# Altium schematic sheet 10-BBCON QCMI SOM.SchDoc: SOM Interface
size 431 x 279 mm; Designer: B. Jordan; DsnPath: G:\My Drive\Quilter Computer - Engineering Assets\NXP i.MX8M-Mini\8MMINILPD4-CPU2-DESIGNFILES\8MMINILPD4-CPU2-DESIGNFILES\SCH-47712_A4.DSN; Author: B. Jordan; DrawnBy: B. Jordan; Revision: 0; SheetNumber: 10; SheetTotal: 10; ENG_APP_DATE: --/--/--; DSN_APP_DATE: --/--/--; CHK_APP_DATE: --/--/--
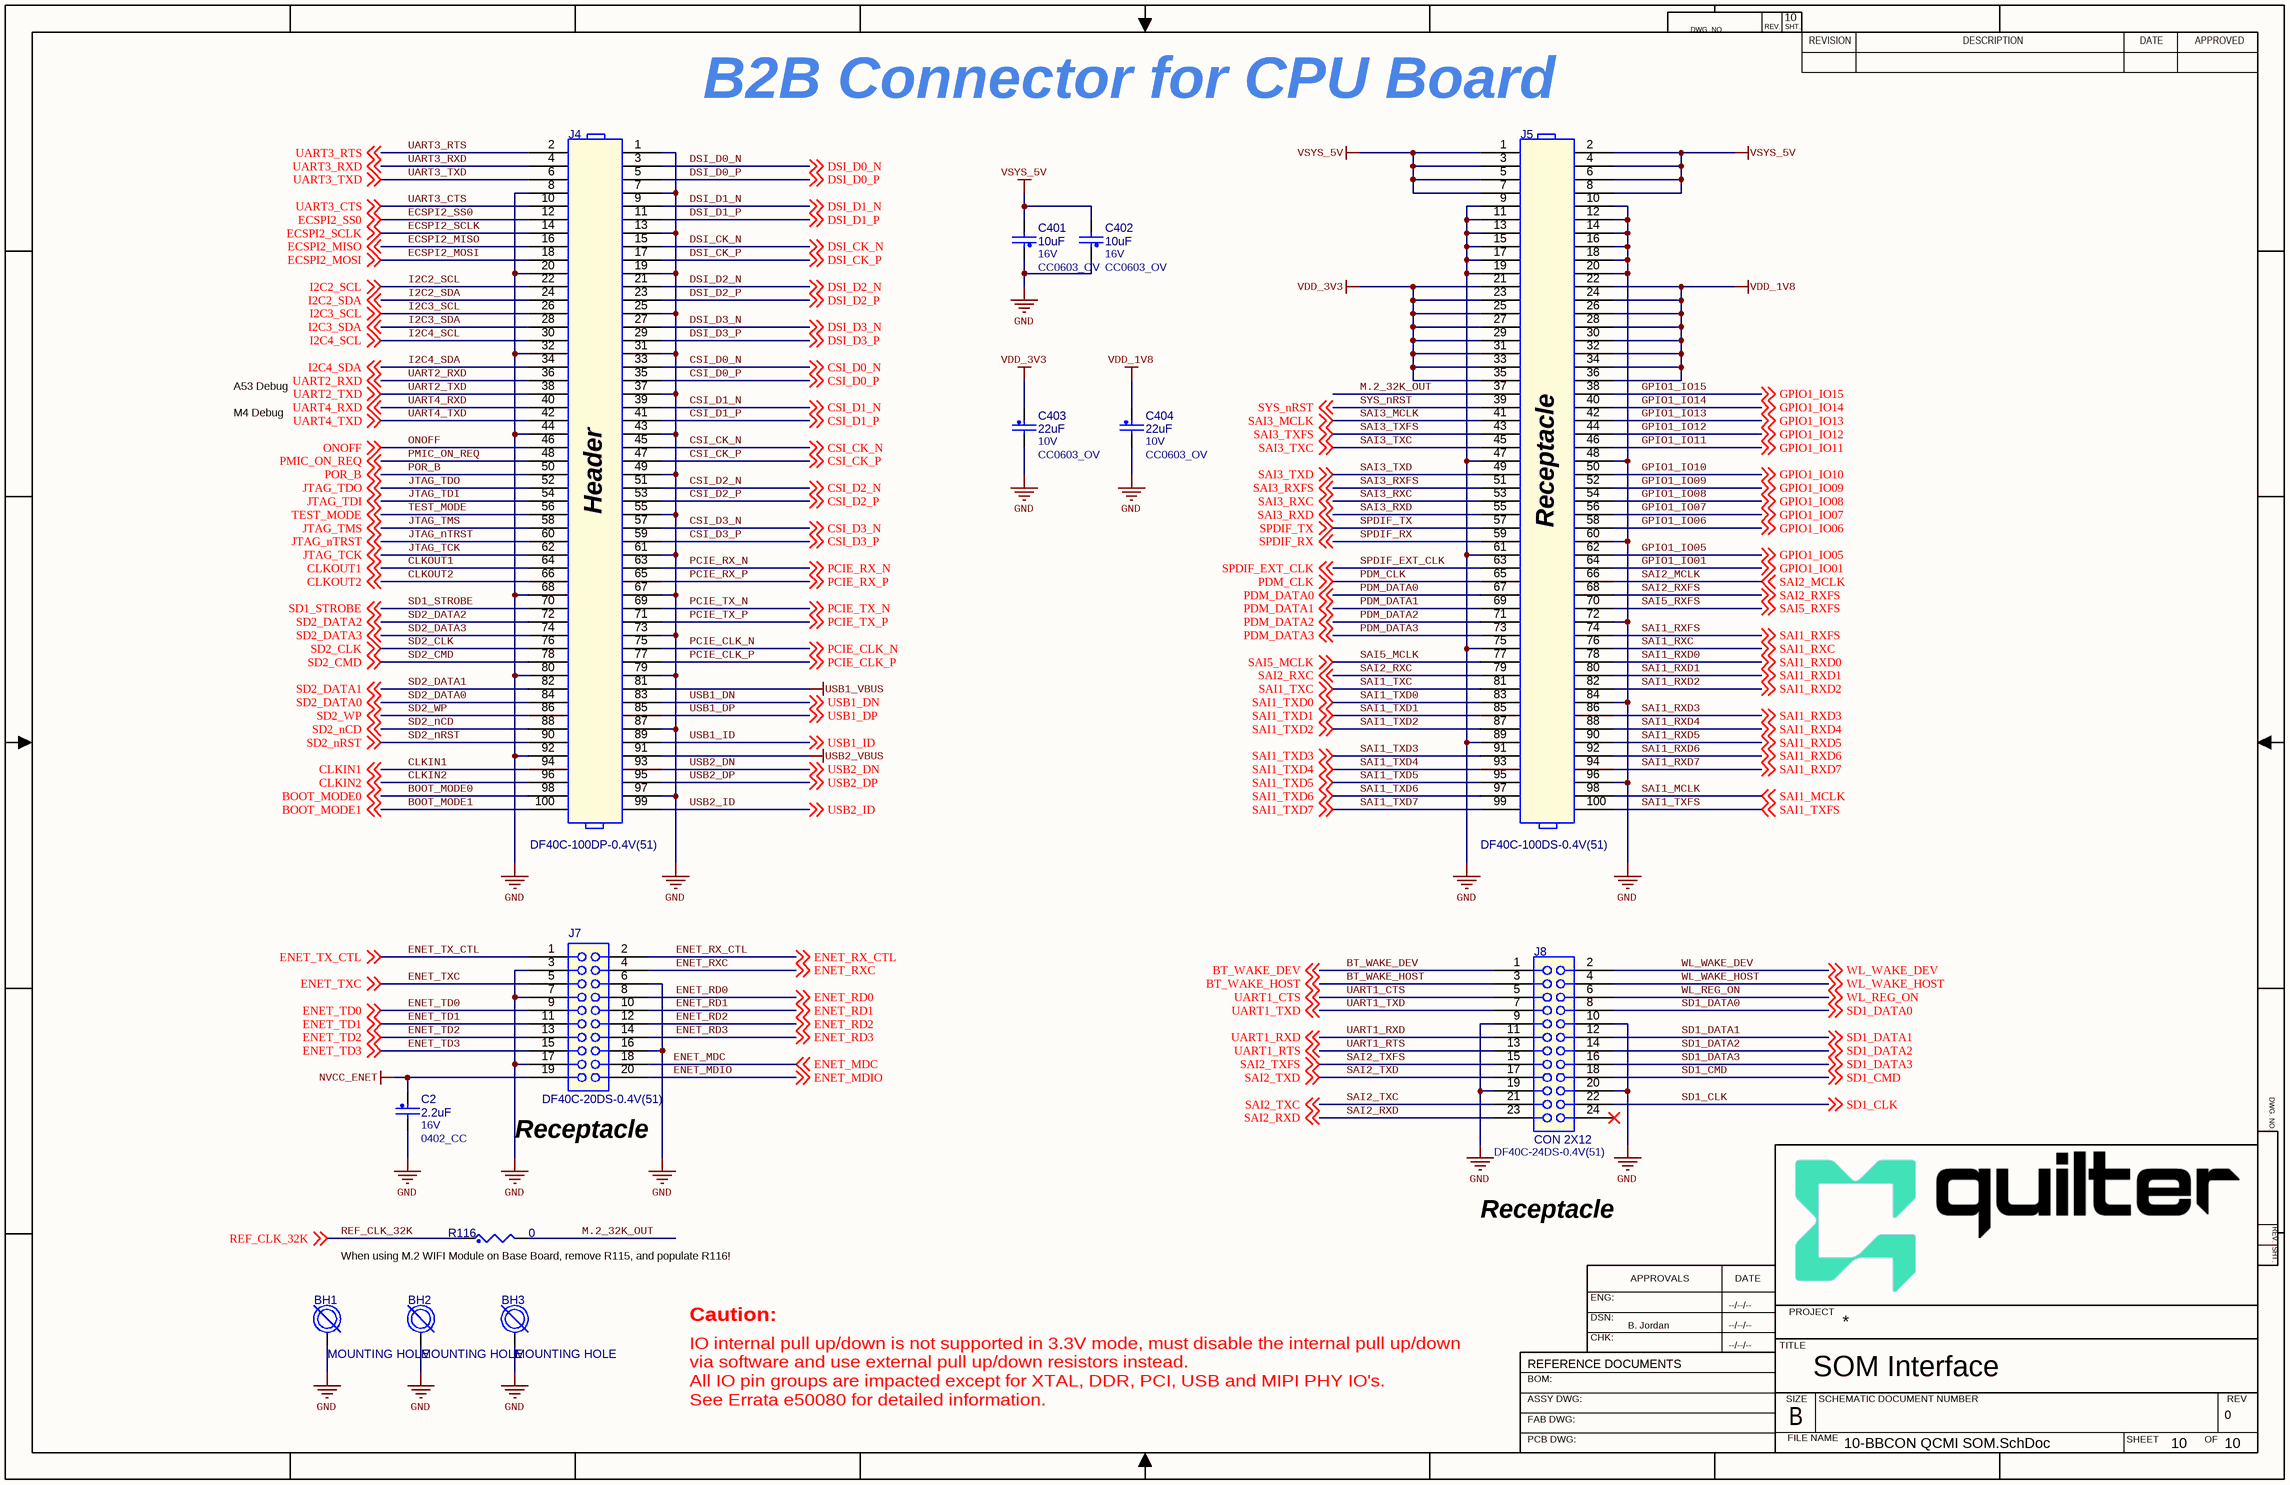
[diagram p0: 10-BBCON QCMI SOM.SchDoc]

## Parts
BH1  MOUNTING HOLE  [GNDPOINT256]
BH2  MOUNTING HOLE  [GNDPOINT256]
BH3  MOUNTING HOLE  [GNDPOINT256]
C2  2.2uF  VOLTAGE: 16V  [0402_CC]
C401  10uF  VOLTAGE: 16V  [CC0603_OV]
C402  10uF  VOLTAGE: 16V  [CC0603_OV]
C403  22uF  VOLTAGE: 10V  [CC0603_OV]
C404  22uF  VOLTAGE: 10V  [CC0603_OV]
J4  DF40C-100DP-0.4V(51)  [con100_0p4_21p7x2p05_sm]
J5  DF40C-100DS-0.4V(51)  [con100_0p4_22p8x3p1_sm]
J7  DF40C-20DS-0.4V(51)  [con20_0p4_6p8x3p1_sm]
J8  CON 2X12  MFG_PN01: DF40C-24DS-0.4V(51)  [con24_0p4_7p6x3p08_sm]
R116  0  [RC0402_25]

## Nets
GND: BH1.1 BH2.1 BH3.1 C2.2 C401.1 C402.1 C403.2 C404.2 J4.1 J4.7 J4.8 J4.13 J4.19 J4.20 J4.25 J4.31 J4.32 J4.37 J4.43 J4.44 J4.49 J4.55 J4.61 J4.67 J4.68 J4.73 J4.79 J4.80 J4.87 J4.92 J4.97 J5.9 J5.10 J5.11 J5.12 J5.13 J5.14 J5.15 J5.16 J5.17 J5.18 J5.19 J5.20 J5.47 J5.48 J5.60 J5.61 J5.72 J5.75 J5.84 J5.89 J5.96 J7.3 J7.6 J7.7 J7.16 J7.17 J8.9(A5) J8.10(B5) J8.19(A10) J8.20(B10)
NVCC_ENET: C2.1 J7.19
USB1_VBUS: J4.81
USB2_VBUS: J4.91
VDD_1V8: C404.1 J5.22 J5.24 J5.26 J5.28 J5.30 J5.32 J5.34 J5.36
VDD_3V3: C403.1 J5.21 J5.23 J5.25 J5.27 J5.29 J5.31 J5.33 J5.35
VSYS_5V: C401.2 C402.2 J5.1 J5.2 J5.3 J5.4 J5.5 J5.6 J5.7 J5.8
BOOT_MODE0: J4.98 ; off-sheet BOOT_MODE0
BOOT_MODE1: J4.100 ; off-sheet BOOT_MODE1
BT_WAKE_DEV: J8.1(A1) ; off-sheet BT_WAKE_DEV
BT_WAKE_HOST: J8.3(A2) ; off-sheet BT_WAKE_HOST
CLKIN1: J4.94 ; off-sheet CLKIN1
CLKIN2: J4.96 ; off-sheet CLKIN2
CLKOUT1: J4.64 ; off-sheet CLKOUT1
CLKOUT2: J4.66 ; off-sheet CLKOUT2
CSI_CK_N: J4.45 ; off-sheet CSI_CK_N
CSI_CK_P: J4.47 ; off-sheet CSI_CK_P
CSI_D0_N: J4.33 ; off-sheet CSI_D0_N
CSI_D0_P: J4.35 ; off-sheet CSI_D0_P
CSI_D1_N: J4.39 ; off-sheet CSI_D1_N
CSI_D1_P: J4.41 ; off-sheet CSI_D1_P
CSI_D2_N: J4.51 ; off-sheet CSI_D2_N
CSI_D2_P: J4.53 ; off-sheet CSI_D2_P
CSI_D3_N: J4.57 ; off-sheet CSI_D3_N
CSI_D3_P: J4.59 ; off-sheet CSI_D3_P
DSI_CK_N: J4.15 ; off-sheet DSI_CK_N
DSI_CK_P: J4.17 ; off-sheet DSI_CK_P
DSI_D0_N: J4.3 ; off-sheet DSI_D0_N
DSI_D0_P: J4.5 ; off-sheet DSI_D0_P
DSI_D1_N: J4.9 ; off-sheet DSI_D1_N
DSI_D1_P: J4.11 ; off-sheet DSI_D1_P
DSI_D2_N: J4.21 ; off-sheet DSI_D2_N
DSI_D2_P: J4.23 ; off-sheet DSI_D2_P
DSI_D3_N: J4.27 ; off-sheet DSI_D3_N
DSI_D3_P: J4.29 ; off-sheet DSI_D3_P
ECSPI2_MISO: J4.16 ; off-sheet ECSPI2_MISO
ECSPI2_MOSI: J4.18 ; off-sheet ECSPI2_MOSI
ECSPI2_SCLK: J4.14 ; off-sheet ECSPI2_SCLK
ECSPI2_SS0: J4.12 ; off-sheet ECSPI2_SS0
ENET_MDC: J7.18 ; off-sheet ENET_MDC
ENET_MDIO: J7.20 ; off-sheet ENET_MDIO
ENET_RD0: J7.8 ; off-sheet ENET_RD0
ENET_RD1: J7.10 ; off-sheet ENET_RD1
ENET_RD2: J7.12 ; off-sheet ENET_RD2
ENET_RD3: J7.14 ; off-sheet ENET_RD3
ENET_RX_CTL: J7.2 ; off-sheet ENET_RX_CTL
ENET_RXC: J7.4 ; off-sheet ENET_RXC
ENET_TD0: J7.9 ; off-sheet ENET_TD0
ENET_TD1: J7.11 ; off-sheet ENET_TD1
ENET_TD2: J7.13 ; off-sheet ENET_TD2
ENET_TD3: J7.15 ; off-sheet ENET_TD3
ENET_TX_CTL: J7.1 ; off-sheet ENET_TX_CTL
ENET_TXC: J7.5 ; off-sheet ENET_TXC
GPIO1_IO01: J5.64 ; off-sheet GPIO1_IO01
GPIO1_IO05: J5.62 ; off-sheet GPIO1_IO05
GPIO1_IO06: J5.58 ; off-sheet GPIO1_IO06
GPIO1_IO07: J5.56 ; off-sheet GPIO1_IO07
GPIO1_IO08: J5.54 ; off-sheet GPIO1_IO08
GPIO1_IO09: J5.52 ; off-sheet GPIO1_IO09
GPIO1_IO10: J5.50 ; off-sheet GPIO1_IO10
GPIO1_IO11: J5.46 ; off-sheet GPIO1_IO11
GPIO1_IO12: J5.44 ; off-sheet GPIO1_IO12
GPIO1_IO13: J5.42 ; off-sheet GPIO1_IO13
GPIO1_IO14: J5.40 ; off-sheet GPIO1_IO14
GPIO1_IO15: J5.38 ; off-sheet GPIO1_IO15
I2C2_SCL: J4.22 ; off-sheet I2C2_SCL
I2C2_SDA: J4.24 ; off-sheet I2C2_SDA
I2C3_SCL: J4.26 ; off-sheet I2C3_SCL
I2C3_SDA: J4.28 ; off-sheet I2C3_SDA
I2C4_SCL: J4.30 ; off-sheet I2C4_SCL
I2C4_SDA: J4.34 ; off-sheet I2C4_SDA
JTAG_nTRST: J4.60 ; off-sheet JTAG_nTRST
JTAG_TCK: J4.62 ; off-sheet JTAG_TCK
JTAG_TDI: J4.54 ; off-sheet JTAG_TDI
JTAG_TDO: J4.52 ; off-sheet JTAG_TDO
JTAG_TMS: J4.58 ; off-sheet JTAG_TMS
M.2_32K_OUT: J5.37 R116.2
ONOFF: J4.46 ; off-sheet ONOFF
PCIE_CLK_N: J4.75 ; off-sheet PCIE_CLK_N
PCIE_CLK_P: J4.77 ; off-sheet PCIE_CLK_P
PCIE_RX_N: J4.63 ; off-sheet PCIE_RX_N
PCIE_RX_P: J4.65 ; off-sheet PCIE_RX_P
PCIE_TX_N: J4.69 ; off-sheet PCIE_TX_N
PCIE_TX_P: J4.71 ; off-sheet PCIE_TX_P
PDM_CLK: J5.65 ; off-sheet PDM_CLK
PDM_DATA0: J5.67 ; off-sheet PDM_DATA0
PDM_DATA1: J5.69 ; off-sheet PDM_DATA1
PDM_DATA2: J5.71 ; off-sheet PDM_DATA2
PDM_DATA3: J5.73 ; off-sheet PDM_DATA3
PMIC_ON_REQ: J4.48 ; off-sheet PMIC_ON_REQ
POR_B: J4.50 ; off-sheet POR_B
REF_CLK_32K: R116.1 ; off-sheet REF_CLK_32K
SAI1_MCLK: J5.98 ; off-sheet SAI1_MCLK
SAI1_RXC: J5.76 ; off-sheet SAI1_RXC
SAI1_RXD0: J5.78 ; off-sheet SAI1_RXD0
SAI1_RXD1: J5.80 ; off-sheet SAI1_RXD1
SAI1_RXD2: J5.82 ; off-sheet SAI1_RXD2
SAI1_RXD3: J5.86 ; off-sheet SAI1_RXD3
SAI1_RXD4: J5.88 ; off-sheet SAI1_RXD4
SAI1_RXD5: J5.90 ; off-sheet SAI1_RXD5
SAI1_RXD6: J5.92 ; off-sheet SAI1_RXD6
SAI1_RXD7: J5.94 ; off-sheet SAI1_RXD7
SAI1_RXFS: J5.74 ; off-sheet SAI1_RXFS
SAI1_TXC: J5.81 ; off-sheet SAI1_TXC
SAI1_TXD0: J5.83 ; off-sheet SAI1_TXD0
SAI1_TXD1: J5.85 ; off-sheet SAI1_TXD1
SAI1_TXD2: J5.87 ; off-sheet SAI1_TXD2
SAI1_TXD3: J5.91 ; off-sheet SAI1_TXD3
SAI1_TXD4: J5.93 ; off-sheet SAI1_TXD4
SAI1_TXD5: J5.95 ; off-sheet SAI1_TXD5
SAI1_TXD6: J5.97 ; off-sheet SAI1_TXD6
SAI1_TXD7: J5.99 ; off-sheet SAI1_TXD7
SAI1_TXFS: J5.100 ; off-sheet SAI1_TXFS
SAI2_MCLK: J5.66 ; off-sheet SAI2_MCLK
SAI2_RXC: J5.79 ; off-sheet SAI2_RXC
SAI2_RXD: J8.23(A12) ; off-sheet SAI2_RXD
SAI2_RXFS: J5.68 ; off-sheet SAI2_RXFS
SAI2_TXC: J8.21(A11) ; off-sheet SAI2_TXC
SAI2_TXD: J8.17(A9) ; off-sheet SAI2_TXD
SAI2_TXFS: J8.15(A8) ; off-sheet SAI2_TXFS
SAI3_MCLK: J5.41 ; off-sheet SAI3_MCLK
SAI3_RXC: J5.53 ; off-sheet SAI3_RXC
SAI3_RXD: J5.55 ; off-sheet SAI3_RXD
SAI3_RXFS: J5.51 ; off-sheet SAI3_RXFS
SAI3_TXC: J5.45 ; off-sheet SAI3_TXC
SAI3_TXD: J5.49 ; off-sheet SAI3_TXD
SAI3_TXFS: J5.43 ; off-sheet SAI3_TXFS
SAI5_MCLK: J5.77 ; off-sheet SAI5_MCLK
SAI5_RXFS: J5.70 ; off-sheet SAI5_RXFS
SD1_CLK: J8.22(B11) ; off-sheet SD1_CLK
SD1_CMD: J8.18(B9) ; off-sheet SD1_CMD
SD1_DATA0: J8.8(B4) ; off-sheet SD1_DATA0
SD1_DATA1: J8.12(B6) ; off-sheet SD1_DATA1
SD1_DATA2: J8.14(B7) ; off-sheet SD1_DATA2
SD1_DATA3: J8.16(B8) ; off-sheet SD1_DATA3
SD1_STROBE: J4.70 ; off-sheet SD1_STROBE
SD2_CLK: J4.76 ; off-sheet SD2_CLK
SD2_CMD: J4.78 ; off-sheet SD2_CMD
SD2_DATA0: J4.84 ; off-sheet SD2_DATA0
SD2_DATA1: J4.82 ; off-sheet SD2_DATA1
SD2_DATA2: J4.72 ; off-sheet SD2_DATA2
SD2_DATA3: J4.74 ; off-sheet SD2_DATA3
SD2_nCD: J4.88 ; off-sheet SD2_nCD
SD2_nRST: J4.90 ; off-sheet SD2_nRST
SD2_WP: J4.86 ; off-sheet SD2_WP
SPDIF_EXT_CLK: J5.63 ; off-sheet SPDIF_EXT_CLK
SPDIF_RX: J5.59 ; off-sheet SPDIF_RX
SPDIF_TX: J5.57 ; off-sheet SPDIF_TX
SYS_nRST: J5.39 ; off-sheet SYS_nRST
TEST_MODE: J4.56 ; off-sheet TEST_MODE
UART1_CTS: J8.5(A3) ; off-sheet UART1_CTS
UART1_RTS: J8.13(A7) ; off-sheet UART1_RTS
UART1_RXD: J8.11(A6) ; off-sheet UART1_RXD
UART1_TXD: J8.7(A4) ; off-sheet UART1_TXD
UART2_RXD: J4.36 ; off-sheet UART2_RXD
UART2_TXD: J4.38 ; off-sheet UART2_TXD
UART3_CTS: J4.10 ; off-sheet UART3_CTS
UART3_RTS: J4.2 ; off-sheet UART3_RTS
UART3_RXD: J4.4 ; off-sheet UART3_RXD
UART3_TXD: J4.6 ; off-sheet UART3_TXD
UART4_RXD: J4.40 ; off-sheet UART4_RXD
UART4_TXD: J4.42 ; off-sheet UART4_TXD
USB1_DN: J4.83 ; off-sheet USB1_DN
USB1_DP: J4.85 ; off-sheet USB1_DP
USB1_ID: J4.89 ; off-sheet USB1_ID
USB2_DN: J4.93 ; off-sheet USB2_DN
USB2_DP: J4.95 ; off-sheet USB2_DP
USB2_ID: J4.99 ; off-sheet USB2_ID
WL_REG_ON: J8.6(B3) ; off-sheet WL_REG_ON
WL_WAKE_DEV: J8.2(B1) ; off-sheet WL_WAKE_DEV
WL_WAKE_HOST: J8.4(B2) ; off-sheet WL_WAKE_HOST

Not connected (* = marked no-connect by the designer): J8 24(B12)*

## Notes on the sheet
- (near J5) B2B Connector for CPU Board
- A53 Debug
- M4 Debug
- (near J4) Header
- (near J5) Receptacle
- (near J7) Receptacle
- Receptacle
- (near R116) When using M.2 WIFI Module on Base Board, remove R115, and populate R116!
- Caution:
- IO internal pull up/down is not supported in 3.3V mode, must disable the internal pull up/down
  via software and use external pull up/down resistors instead.
  All IO pin groups are impacted except for XTAL, DDR, PCI, USB and MIPI PHY IO's.
  See Errata e50080 for detailed information.
- DWG. NO.
- REV.
- SHT.
- REVISION
- DESCRIPTION
- DATE
- APPROVED
- ENG:
- APPROVALS
- REFERENCE DOCUMENTS
- DSN:
- CHK:
- TITLE
- PROJECT
- BOM:
- ASSY DWG:
- FAB DWG:
- SIZE
- FILE NAME
- B
- SCHEMATIC DOCUMENT NUMBER
- SHEET
- OF
- REV
- PCB DWG:

## Library data of the parts
BH1-BH3 = MOUNT_HOLE: MOUNTING HOLE DRILL 109 PAD 200 PLATED TH NO PART TO ORDER; Value: MOUNTING HOLE; PCB Footprint: GNDPOINT256; ROHS: Yes
C2 = CAP_NP: CAP CER 2.2uF 16V 10% X5R 0402; MFG_PN01: GRM155R61C225KE44; MFG_NAME01: MURATA; EIA Case: 0402; Temp Range: -55°C ~ 85°C; Value: 2.2uF; PCB Footprint: 0402_CC; ROHS: Yes; Tolerance: 10%
C401 = CAP_NP: CAP CER 10.0uF 16V 10% X5R 0603; MFG_PN01: GRM188R61C106KAALD; MFG_NAME01: MURATA; EIA Case: 0603; Temp Range: -55°C ~ 85°C; Value: 10uF; ROHS: Yes; Tolerance: 10%; PCB Footprint: CC0603_OV
C402 = CAP_NP: CAP CER 10.0uF 16V 10% X5R 0603; MFG_NAME01: MURATA; MFG_PN01: GRM188R61C106KAALD; EIA Case: 0603; Temp Range: -55°C ~ 85°C; Value: 10uF; Tolerance: 10%; ROHS: Yes; PCB Footprint: CC0603_OV
C403 C404 = CAP_NP: CAP CER 22uF 10V 20% X5R 0603; MFG_PN01: C1608X5R1A226M080AC; MFG_NAME01: TDK; EIA Case: 0603; Value: 22uF; ROHS: Yes; Tolerance: 20%; PCB Footprint: CC0603_OV
J4 = HDR_2X50_M: CON 2X50 PLUG SHRD SMT 0.4MM SP 51H AU; MFG_NAME01: HIROSE; Temp Range: -35°C ~ 85°C; System: Connector; Value: DF40C-100DP-0.4V(51); PCB Footprint: con100_0p4_21p7x2p05_sm; MFG_PN01: DF40C-100DP-0.4V(51); ROHS: Yes
J5 = HDR_2X50_M: CON 2X50 SKT SHRD SMT 0.4MM SP 65H AU; MFG_NAME01: HIROSE; Temp Range: -35°C ~ 85°C; System: Connector; Value: DF40C-100DS-0.4V(51); PCB Footprint: con100_0p4_22p8x3p1_sm; ROHS: Yes; MFG_PN01: DF40C-100DS-0.4V(51)
J7 = CONN_HDR_10X2: CON 2X10 SKT SHRD SMT 0.4MM SP 63H AU; MFG_NAME01: HIROSE; Temp Range: -35°C ~ 85°C; System: Connector; Value: DF40C-20DS-0.4V(51); MFG_PN01: DF40C-20DS-0.4V(51); ROHS: Yes; PCB Footprint: con20_0p4_6p8x3p1_sm
J8 = CONN_HDR_12X2: CON 2X12 SKT SHRD SMT 0.4MM SP 65H AU; MFG_NAME01: HIROSE; System: Connector; Value: CON 2X12; PCB Footprint: con24_0p4_7p6x3p08_sm; ROHS: Yes
R116 = RES: RES MF ZERO OHM 1/16W 5% 0402; MFG_PN01: MCR01MZPJ000; MFG_NAME01: ROHM; EIA Case: 0402; Value: 0; ROHS: Yes; Tolerance: 5%; PCB Footprint: RC0402_25; Rated Power: 1/16W